# Altium schematic sheet Sheet_final.SchDoc
size A; SheetNumber: 1; SheetTotal: 1; SPICEModelCacheDWDDYTZB: <root> / <DocumentId>DWDDYTZB</DocumentId> / </root>
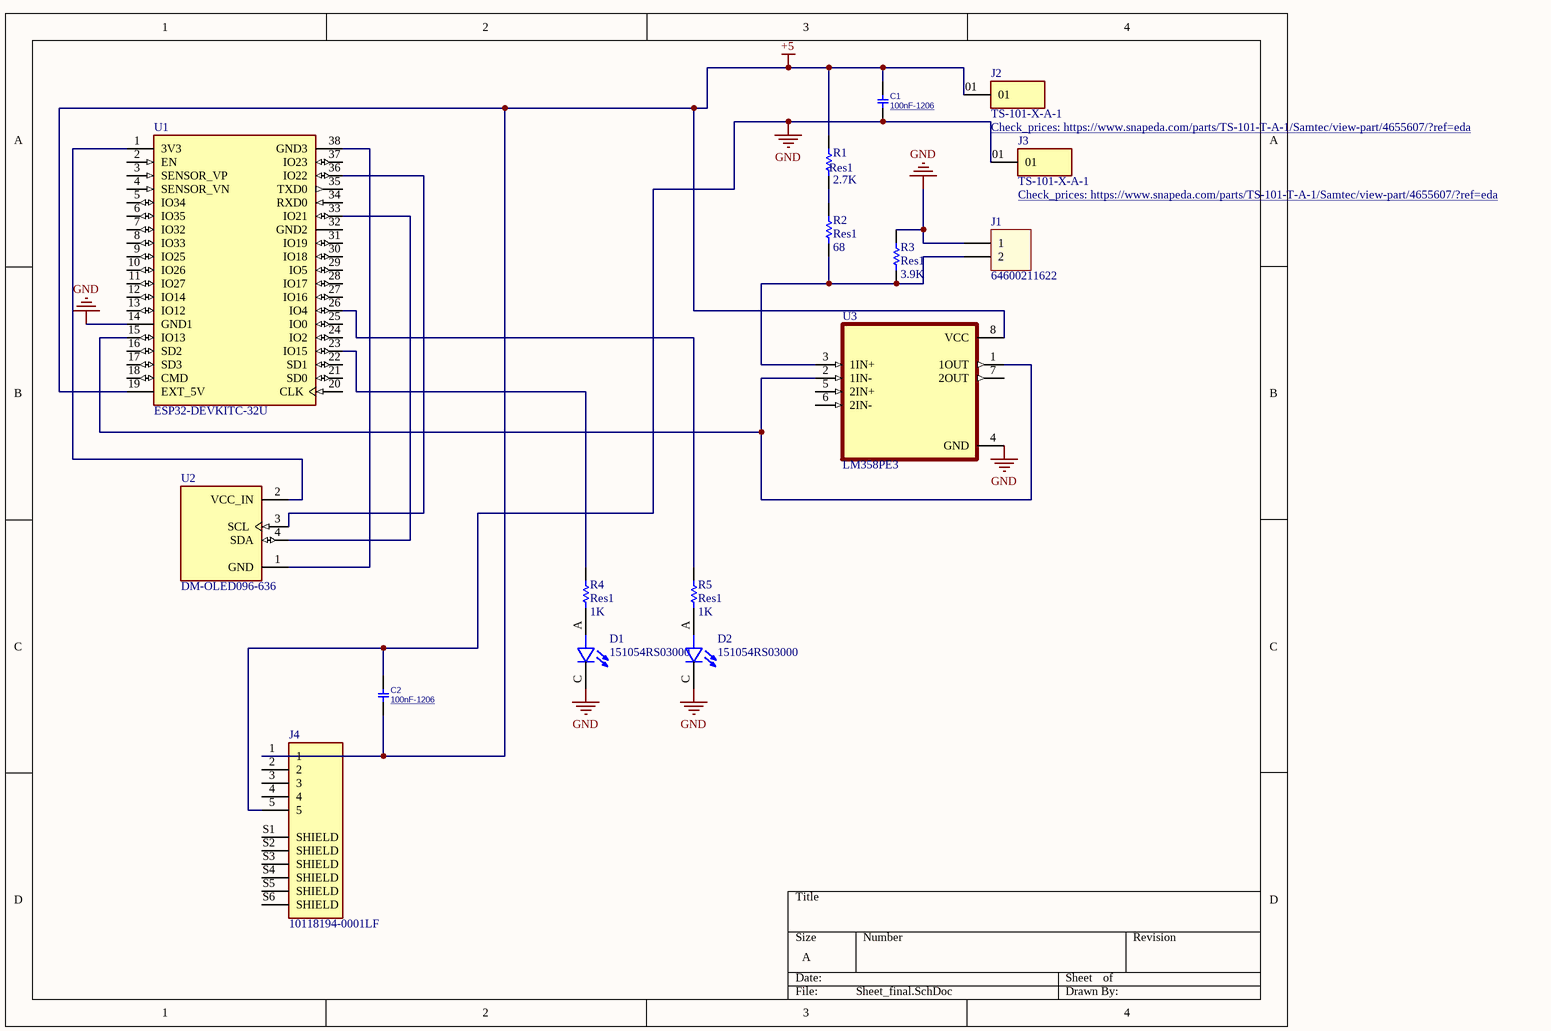
[diagram p0: Sheet_final.SchDoc]

## Parts
C1  100nF-1206  [C1206]
C2  100nF-1206  [C1206]
D1  151054RS03000  [LED_151054RS03000]
D2  151054RS03000  [LED_151054RS03000]
J1  64600211622  [64600211622]
J2  TS-101-X-A-1  [SAMTEC_TS-101-X-A-1]
J3  TS-101-X-A-1  [SAMTEC_TS-101-X-A-1]
J4  10118194-0001LF  [AMPHENOL_10118194-0001LF]
R1  Res1  value 2.7K  [AXIAL-0.3]
R2  Res1  value 68  [AXIAL-0.3]
R3  Res1  value 3.9K  [AXIAL-0.3]
R4  Res1  value 1K  [AXIAL-0.3]
R5  Res1  value 1K  [AXIAL-0.3]
U1  ESP32-DEVKITC-32U  [MODULE_ESP32-DEVKITC-32U]
U2  DM-OLED096-636  [MODULE_DM-OLED096-636]
U3  LM358PE3  [DIP794W45P254L959H508Q8]

## Nets
+5: C1.2 C2.1 J2.01 J4.1 R1.2 U1.19(EXT_5V) U3.8(VCC)
GND: C1.1 C2.2 D1.C D2.C J1.1 J3.01 J4.5 R3.2 U1.14(GND1) U3.4(GND)
NetD1_A: D1.A R4.1
NetD2_A: D2.A R5.1
NetJ1_2: J1.2 R2.1 R3.1 U3.3(1IN+)
NetR1_1: R1.1 R2.2
NetR4_2: R4.2 U1.23(IO15)
NetR5_2: R5.2 U1.26(IO4)
NetU1_1: U1.1(3V3) U2.2(VCC_IN)
NetU1_15: U1.15(IO13) U3.1(1OUT) U3.2(1IN-)
NetU1_33: U1.33(IO21) U2.4(SDA)
NetU1_36: U1.36(IO22) U2.3(SCL)
NetU1_38: U1.38(GND3) U2.1(GND)

Not connected (* = marked no-connect by the designer): J4 2 3 4 S1(SHIELD) S2(SHIELD) S3(SHIELD) S4(SHIELD) S5(SHIELD) S6(SHIELD); U1 2(EN) 3(SENSOR_VP) 4(SENSOR_VN) 5(IO34) 6(IO35) 7(IO32) 8(IO33) 9(IO25) 10(IO26) 11(IO27) 12(IO14) 13(IO12) 16(SD2) 17(SD3) 18(CMD) 20(CLK) 21(SD0) 22(SD1) 24(IO2) 25(IO0) 27(IO16) 28(IO17) 29(IO5) 30(IO18) 31(IO19) 32(GND2) 34(RXD0) 35(TXD0) 37(IO23); U3 5(2IN+) 6(2IN-) 7(2OUT)

## Library data of the parts
C1 C2 = CAP_SMD_MLCC_1206: CAP, MLCC, -F, -V, MATERIAL, -%, 0201; PARAM: -, -%; MANF_P#: MANF_PART#; PRICE: 100= 1$; MANF: -; PARAM2: -V; ASSEMBLY: ASSEMBLY; VALUE: 100nF-1206
D1 D2 = 151054RS03000: Red 623nm LED Indication - Discrete 1.9V Radial; MF: Wurth Elektronik; Value: *; SnapEDA_Link: https://www.snapeda.com/parts/151054RS03000/Wurth+Elektronik/view-part/?ref=snap; Purchase-URL: https://pricing.snapeda.com/search/part/151054RS03000/?ref=eda; Availability: In Stock; Price: None; Package: Radial Wurth Elektronik; Check_prices: https://www.snapeda.com/parts/151054RS03000/Wurth+Elektronik/view-part/?ref=eda; MP: 151054RS03000
J1 = 64600211622: WR-WTB 2.50mm Male Shrouded Header, 2p; Pin Number: 2; ComponentLink1Description: Manufacturer; ComponentLink1URL: http://www.we-online.de; ComponentLink2Description: Datasheet; ComponentLink2URL: http://katalog.we-online.de/em/datasheet/6460xx11622.pdf; Part Number: 64600211622; Published Date: June 2017; Publisher: Wurth Elektronik; Pitch: 2.50 mm
J2 J3 = TS-101-X-A-1: Connector Header Through Hole 1 position; MF: Samtec Inc.; MP: TS-101-T-A-1; Price: None; SnapEDA_Link: https://www.snapeda.com/parts/TS-101-T-A-1/Samtec/view-part/4655607/?ref=snap; Value: *; Package: None; Availability: Bad; Check_prices: https://www.snapeda.com/parts/TS-101-T-A-1/Samtec/view-part/4655607/?ref=eda
J4 = 10118194-0001LF: Micro USB, Input Output Connectors, B TYPE RECEPTACLE with flange; MF: Amphenol ICC; Package: None; Price: None; Check_prices: https://www.snapeda.com/parts/10118194-0001LF/Amphenol+FCI/view-part/?ref=eda; Value: *; SnapEDA_Link: https://www.snapeda.com/parts/10118194-0001LF/Amphenol+FCI/view-part/?ref=snap; MP: 10118194-0001LF; Availability: In Stock; Purchase-URL: https://pricing.snapeda.com/search/part/10118194-0001LF/?ref=eda
R1-R5 = Res1: Resistor; Published: 8-Jun-2000; LatestRevisionDate: 17-Jul-2002; LatestRevisionNote: Re-released for DXP Platform.; PackageReference: AXIAL-0.3; Publisher: Altium Limited; PackageDescription: Axial Device, Thru-Hole; 2 Leads; 0.3 in Pin Spacing
U1 = ESP32-DEVKITC-32U: ESP32-WROOM-32UE series Transceiver; 802.11 b/g/n (Wi-Fi, WiFi, WLAN), Bluetooth® Smart Ready 4.x Dual Mode Evaluation Board; MF: Espressif Systems; SnapEDA_Link: https://www.snapeda.com/parts/ESP32-DEVKITC-32U/Espressif+Systems/view-part/?ref=snap; Package: CUSTOM-38 ESPRESSIF; Value: *; MP: ESP32-DEVKITC-32U; Check_prices: https://www.snapeda.com/parts/ESP32-DEVKITC-32U/Espressif+Systems/view-part/?ref=eda
U2 = DM-OLED096-636: 0.96â€ 128 X 64 MONOCHROME GRAPHIC OLED DISPLAY MODULE - I2C; SnapEDA_Link: https://www.snapeda.com/parts/DM-OLED096-636/Display+Module/view-part/?ref=snap; Package: Package; Value: *; MF: Display Module; MP: DM-OLED096-636; Check_prices: https://www.snapeda.com/parts/DM-OLED096-636/Display+Module/view-part/?ref=eda
U3 = LM358PE3: Value: *; MP: LM358PE3; Package: None; Availability: Unavailable; Price: None